# Altium schematic sheet eMMC_Sheet.SchDoc
size A4; DocumentNumber: 13; SheetNumber: 13; SheetTotal: 27
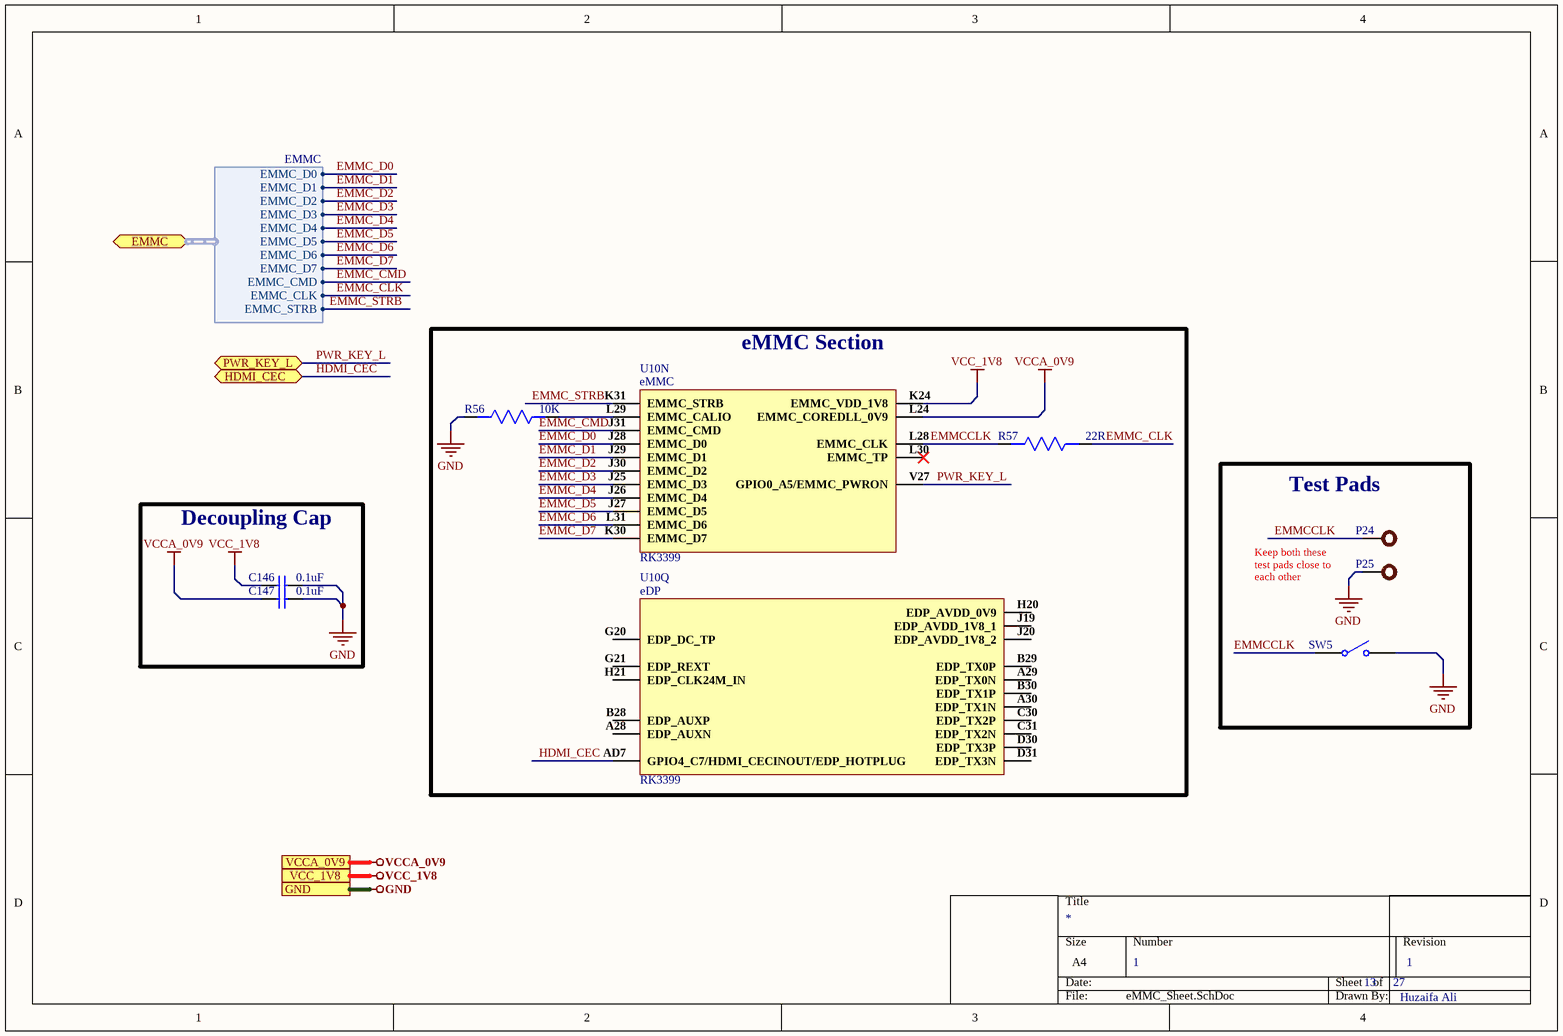
[diagram p0: eMMC_Sheet.SchDoc]

## Parts
C146  0.1uF  [Cap0402]
C147  0.1uF  [Cap0402]
P24  TEST POINT  [TEST POINT]  (value not drawn)
P25  TEST POINT  [TEST POINT]  (value not drawn)
R56  10K  [Res0603]
R57  22R  [Res0603]
SW5  TS-1185EC-C-D-B  [TS-1185EC-C-D-B]  (value not drawn)
U10  RK3399  [RK3399]  (parts N,Q of 34)

## Blocks framed on the sheet
eMMC Section: R56 R57 U10
Decoupling Cap: C146 C147
Test Pads: P24 P25 SW5

## Ports
EMMC (bidir, harness EMMC), GND, HDMI_CEC (bidir), PWR_KEY_L (bidir), VCC_1V8, VCCA_0V9

## Harnesses
EMMC: EMMC_D0, EMMC_D1, EMMC_D2, EMMC_D3, EMMC_D4, EMMC_D5, EMMC_D6, EMMC_D7, EMMC_CMD, EMMC_CLK, EMMC_STRB

## Nets
GND: C146.2 C147.2 P25.1 R56.2 SW5.2 ; port GND
VCC_1V8: C146.1 U10.K24(EMMC_VDD_1V8) ; port VCC_1V8
VCCA_0V9: C147.1 U10.L24(EMMC_COREDLL_0V9) ; port VCCA_0V9
EMMC_CLK: R57.1 ; port EMMC.EMMC_CLK
EMMC_CMD: U10.J31(EMMC_CMD) ; port EMMC.EMMC_CMD
EMMC_D0: U10.J28(EMMC_D0) ; port EMMC.EMMC_D0
EMMC_D1: U10.J29(EMMC_D1) ; port EMMC.EMMC_D1
EMMC_D2: U10.J30(EMMC_D2) ; port EMMC.EMMC_D2
EMMC_D3: U10.J25(EMMC_D3) ; port EMMC.EMMC_D3
EMMC_D4: U10.J26(EMMC_D4) ; port EMMC.EMMC_D4
EMMC_D5: U10.J27(EMMC_D5) ; port EMMC.EMMC_D5
EMMC_D6: U10.L31(EMMC_D6) ; port EMMC.EMMC_D6
EMMC_D7: U10.K30(EMMC_D7) ; port EMMC.EMMC_D7
EMMC_STRB: U10.K31(EMMC_STRB) ; port EMMC.EMMC_STRB
EMMCCLK: P24.1 R57.2 SW5.1 U10.L28(EMMC_CLK)
HDMI_CEC: U10.AD7(GPIO4_C7/HDMI_CECINOUT/EDP_HOTPLUG) ; port HDMI_CEC
PWR_KEY_L: U10.V27(GPIO0_A5/EMMC_PWRON) ; port PWR_KEY_L
NetR56_1: R56.1 U10.L29(EMMC_CALIO)

Not connected (* = marked no-connect by the designer): U10 A28(EDP_AUXN) A29(EDP_TX0N) A30(EDP_TX1N) B28(EDP_AUXP) B29(EDP_TX0P) B30(EDP_TX1P) C30(EDP_TX2P) C31(EDP_TX2N) D30(EDP_TX3P) D31(EDP_TX3N) G20(EDP_DC_TP) G21(EDP_REXT) H20(EDP_AVDD_0V9) H21(EDP_CLK24M_IN) J19(EDP_AVDD_1V8_1) J20(EDP_AVDD_1V8_2) L30(EMMC_TP)*

## Notes on the sheet
- Keep both these test pads close to each other
- 1
- Huzaifa Ali
- (in symbol RK3399, part N) eMMC
- (in symbol RK3399, part Q) eDP

## Library data of the parts
C146 C147 = CC0402KRX5R6BB104: CAP CER 0.1UF 10V X5R 0402; Manufacturer: Yageo; Capacitance: 100nF; Tolerance: 10%; Dissipation Factor: 5%; Insulation Resistance: 10GR; Supplier 1: Digi-Key; Manufacturer Part Number: CC0402KRX5R6BB104; RoHS: Yes; Category: Ceramic Capacitors; Stock 1: 6385580; Pricing 1: 1=0.10000, 10=0.02700, 50=0.01500, 100=0.01220, 500=0.00874, 1000=0.00687, 2500=0.00625, 5000=0.00575 (USD); Mount: Surface Mount; Case/Package: 0402; Number of Pins: 2; Case Code (Imperial): 0402; Case Code (Metric): 1005; Min Operating Temperature: -55°C; Max Operating Temperature: 85°C; Dielectric: X5R; Packaging: Tape and Reel; Voltage Rating: 10V; Package Quantity: 1; Termination: SMD/SMT; Voltage Rating (DC): 10V; Series: CC; Length: 1mm; Width: 0.02inch; Height: 0.5mm; Depth: 0.5mm; Thickness: 0.022inch; Radiation Hardening: No; RoHS Compliant: Yes; REACH SVHC: No SVHC; Lead Free: Lead Free; Halogen Free: Halogen Free; ComponentLink1URL: https://datasheet.ciiva.com/144/mlccorderingcode-144029.pdf?src-supplier=Digi-Key; ComponentLink1Description: https://datasheet.ciiva.com/144/mlccorderingcode-144029.pdf?src-supplier=Digi-Key; ComponentLink2URL: https://datasheet.ciiva.com/144/mlccorderingcode-144028.pdf?src-supplier=Digi-Key; ComponentLink2Description: https://datasheet.ciiva.com/144/mlccorderingcode-144028.pdf?src-supplier=Digi-Key; ComponentLink3URL: https://datasheet.ciiva.com/144/mlccorderingcode-144030.pdf?src-supplier=Digi-Key; ComponentLink3Description: https://datasheet.ciiva.com/144/mlccorderingcode-144030.pdf?src-supplier=Digi-Key; ComponentLink4URL: https://datasheet.ciiva.com/7978/1359354-7978091.pdf?src-supplier=Element14; ComponentLink4Description: https://datasheet.ciiva.com/7978/1359354-7978091.pdf?src-supplier=Element14; ComponentLink5URL: https://datasheet.ciiva.com/11587/upy-gphc-x5r-4v-to-50v-12-11587302.pdf?src-supplier=Avnet; ComponentLink5Description: https://datasheet.ciiva.com/11587/upy-gphc-x5r-4v-to-50v-12-11587302.pdf?src-supplier=Avnet; Supplier Part Number 1: 311-1336-1-ND
P24 P25 = TEST POINT: Test Point ON
R56 = AC0603JR-0710KL: RES SMD 10K OHM 5% 1/10W 0603; Manufacturer: Yageo; Voltage Rating: 50V; Resistance: 10kR; Power Rating: 100mW; Temperature Coefficient: 100ppm/°C; Supplier 1: Future Electronics; Manufacturer Part Number: AC0603JR-0710KL; RoHS: Yes; Category: Chip SMD Resistors; Stock 1: 1533000; Pricing 1: 5000=0.00540 (USD); Case/Package: 0603; Case Code (Imperial): 0603; Case Code (Metric): 1608; Size Code: 0603; Min Operating Temperature: -55°C; Max Operating Temperature: 155°C; Packaging: Tape and Reel; Tolerance: 5%; Package Quantity: 1; Resistor Type: Thick Film; Termination: SMD/SMT; Number of Terminations: 2; Max Power Dissipation: 100mW; Features: Moisture Resistant,Automotive AEC-Q200,Anti-Sulfur; Series: AC; Construction: Rectangular; Length: 0.063inch; Width: 0.031inch; Height: 0.022inch; Depth: 0.8mm; Military Standard: Not; Lead Free: Lead Free; RoHS Compliant: Yes; ComponentLink1URL: https://datasheet.ciiva.com/5562/pyu-ac-51-rohs-l-2-5562553.pdf?src-supplier=Mouser; ComponentLink1Description: https://datasheet.ciiva.com/5562/pyu-ac-51-rohs-l-2-5562553.pdf?src-supplier=Mouser; Supplier Part Number 1: 1029044
R57 = CRCW060322R0JNEAHP: RES SMD 22 OHM 5% 1/3W 0603; Manufacturer: Vishay Dale; Temperature Coefficient: 200ppm/°C; Power Rating: 250mW; Voltage Rating: 75V; Supplier 1: Digi-Key; Manufacturer Part Number: CRCW060322R0JNEAHP; Stock 1: 245392; Pricing 1: 1=0.15, 10=0.129, 100=0.0506, 1000=0.02119, 2500=0.01942 (USD); Mount: Surface Mount; Case/Package: 0603; Weight: 7.1E-05oz; Contact Plating: Tin; Case Code (Imperial): 0603; Case Code (Metric): 1608; Min Operating Temperature: -55°C; Max Operating Temperature: 155°C; Resistance: 22R; Tolerance: 5%; Composition: Thick Film; Packaging: Tape and Reel; Package Quantity: 5000; Military Standard: Not; Length: 1.6mm; Height: 0.45mm; Width: 0.8mm; Depth: 0.85mm; Radiation Hardening: No; Lead Free: Lead Free; ComponentLink1URL: http://www.vishay.com/docs/20043/crcwhpe3.pdf?src-supplier=Avnet+Europe; ComponentLink1Description: http://www.vishay.com/docs/20043/crcwhpe3.pdf?src-supplier=Avnet+Europe; ComponentLink2URL: http://www.mouser.com/ds/2/427/dcrcwe3-109170.pdf?src-supplier=Mouser; ComponentLink2Description: http://www.mouser.com/ds/2/427/dcrcwe3-109170.pdf?src-supplier=Mouser; Supplier Part Number 1: 541-22SACT-ND
SW5 = TS-1185EC-C-D-B: 3mm 2mm Round Button 50mA Top3.65mm SPST 12V SMD Tactile Switches; Manufacturer: XKB; Manufacturer Part Number: TS-1185EC-C-D-B; Footprint: Custom; ComponentLink1Description: LCSC; ComponentLink1URL: https://lcsc.com/product-detail/Tactile-Switches_XKB-Connectivity-TS-1185EC-C-D-B_C318893.html
U10 = RK3399: RK3399 CPU BGA for HD set-top box chip BGA Chipse; Manufacturer: Fuzhou Rockchip Electronics; ComponentLink1Description: Aliexpress; ComponentLink1URL: https://www.aliexpress.com/item/1005001971093459.html?spm=a2g0n.productlist.0.0.3c7csv8Qsv8Quh&browser_id=3ac7e9efb8074641aaabc4d871f09748&aff_trace_key=&aff_platform=msite&m_page_id=181389a08711fc2600d8cc522bab8d702dd4189be0&gclid=&pdp_npi=2%40dis%21USD%21%2123.6%21%21%21%21%21%402101d91e16545120399167831e8b89%21%21sea&algo_pvid=4303aedd-774c-4013-953d-920f10b55003; Manufacturer Part Number: RK3399; Footprint: FCBGA828